# Altium schematic sheet 20_Radar_12V_to_3V3.SchDoc
size 289 x 396 mm
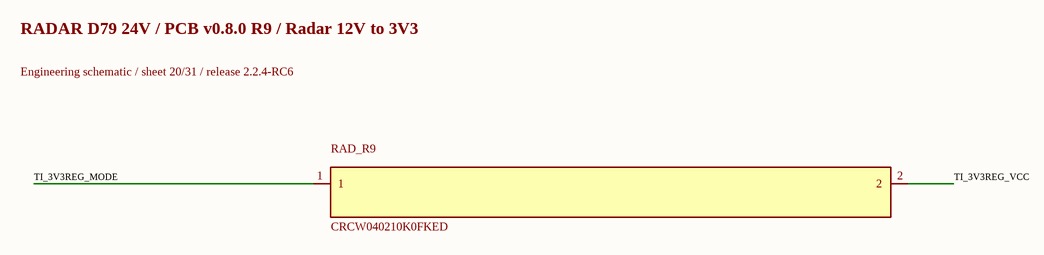
[diagram p0: 20_Radar_12V_to_3V3.SchDoc]

## Parts
RAD_R9  CRCW040210K0FKED  [0402L]

## Nets
TI_3V3REG_MODE: RAD_R9.1
TI_3V3REG_VCC: RAD_R9.2

## Notes on the sheet
- RADAR D79 24V / PCB v0.8.0 R9 / Radar 12V to 3V3
- Engineering schematic / sheet 20/31 / release 2.2.4-RC6